# EasyEDA Pro project 接收机铝基板.epro

# Schematic Schematic1
Board Name: Board1; Create Date: 2025-01-26; Page Name: P1; Project Name: 接收机; Schematic Name: Schematic1; Update Date: 2025-01-26; Company: 嘉立创EDA; Page Size: A3; Version: V1.0
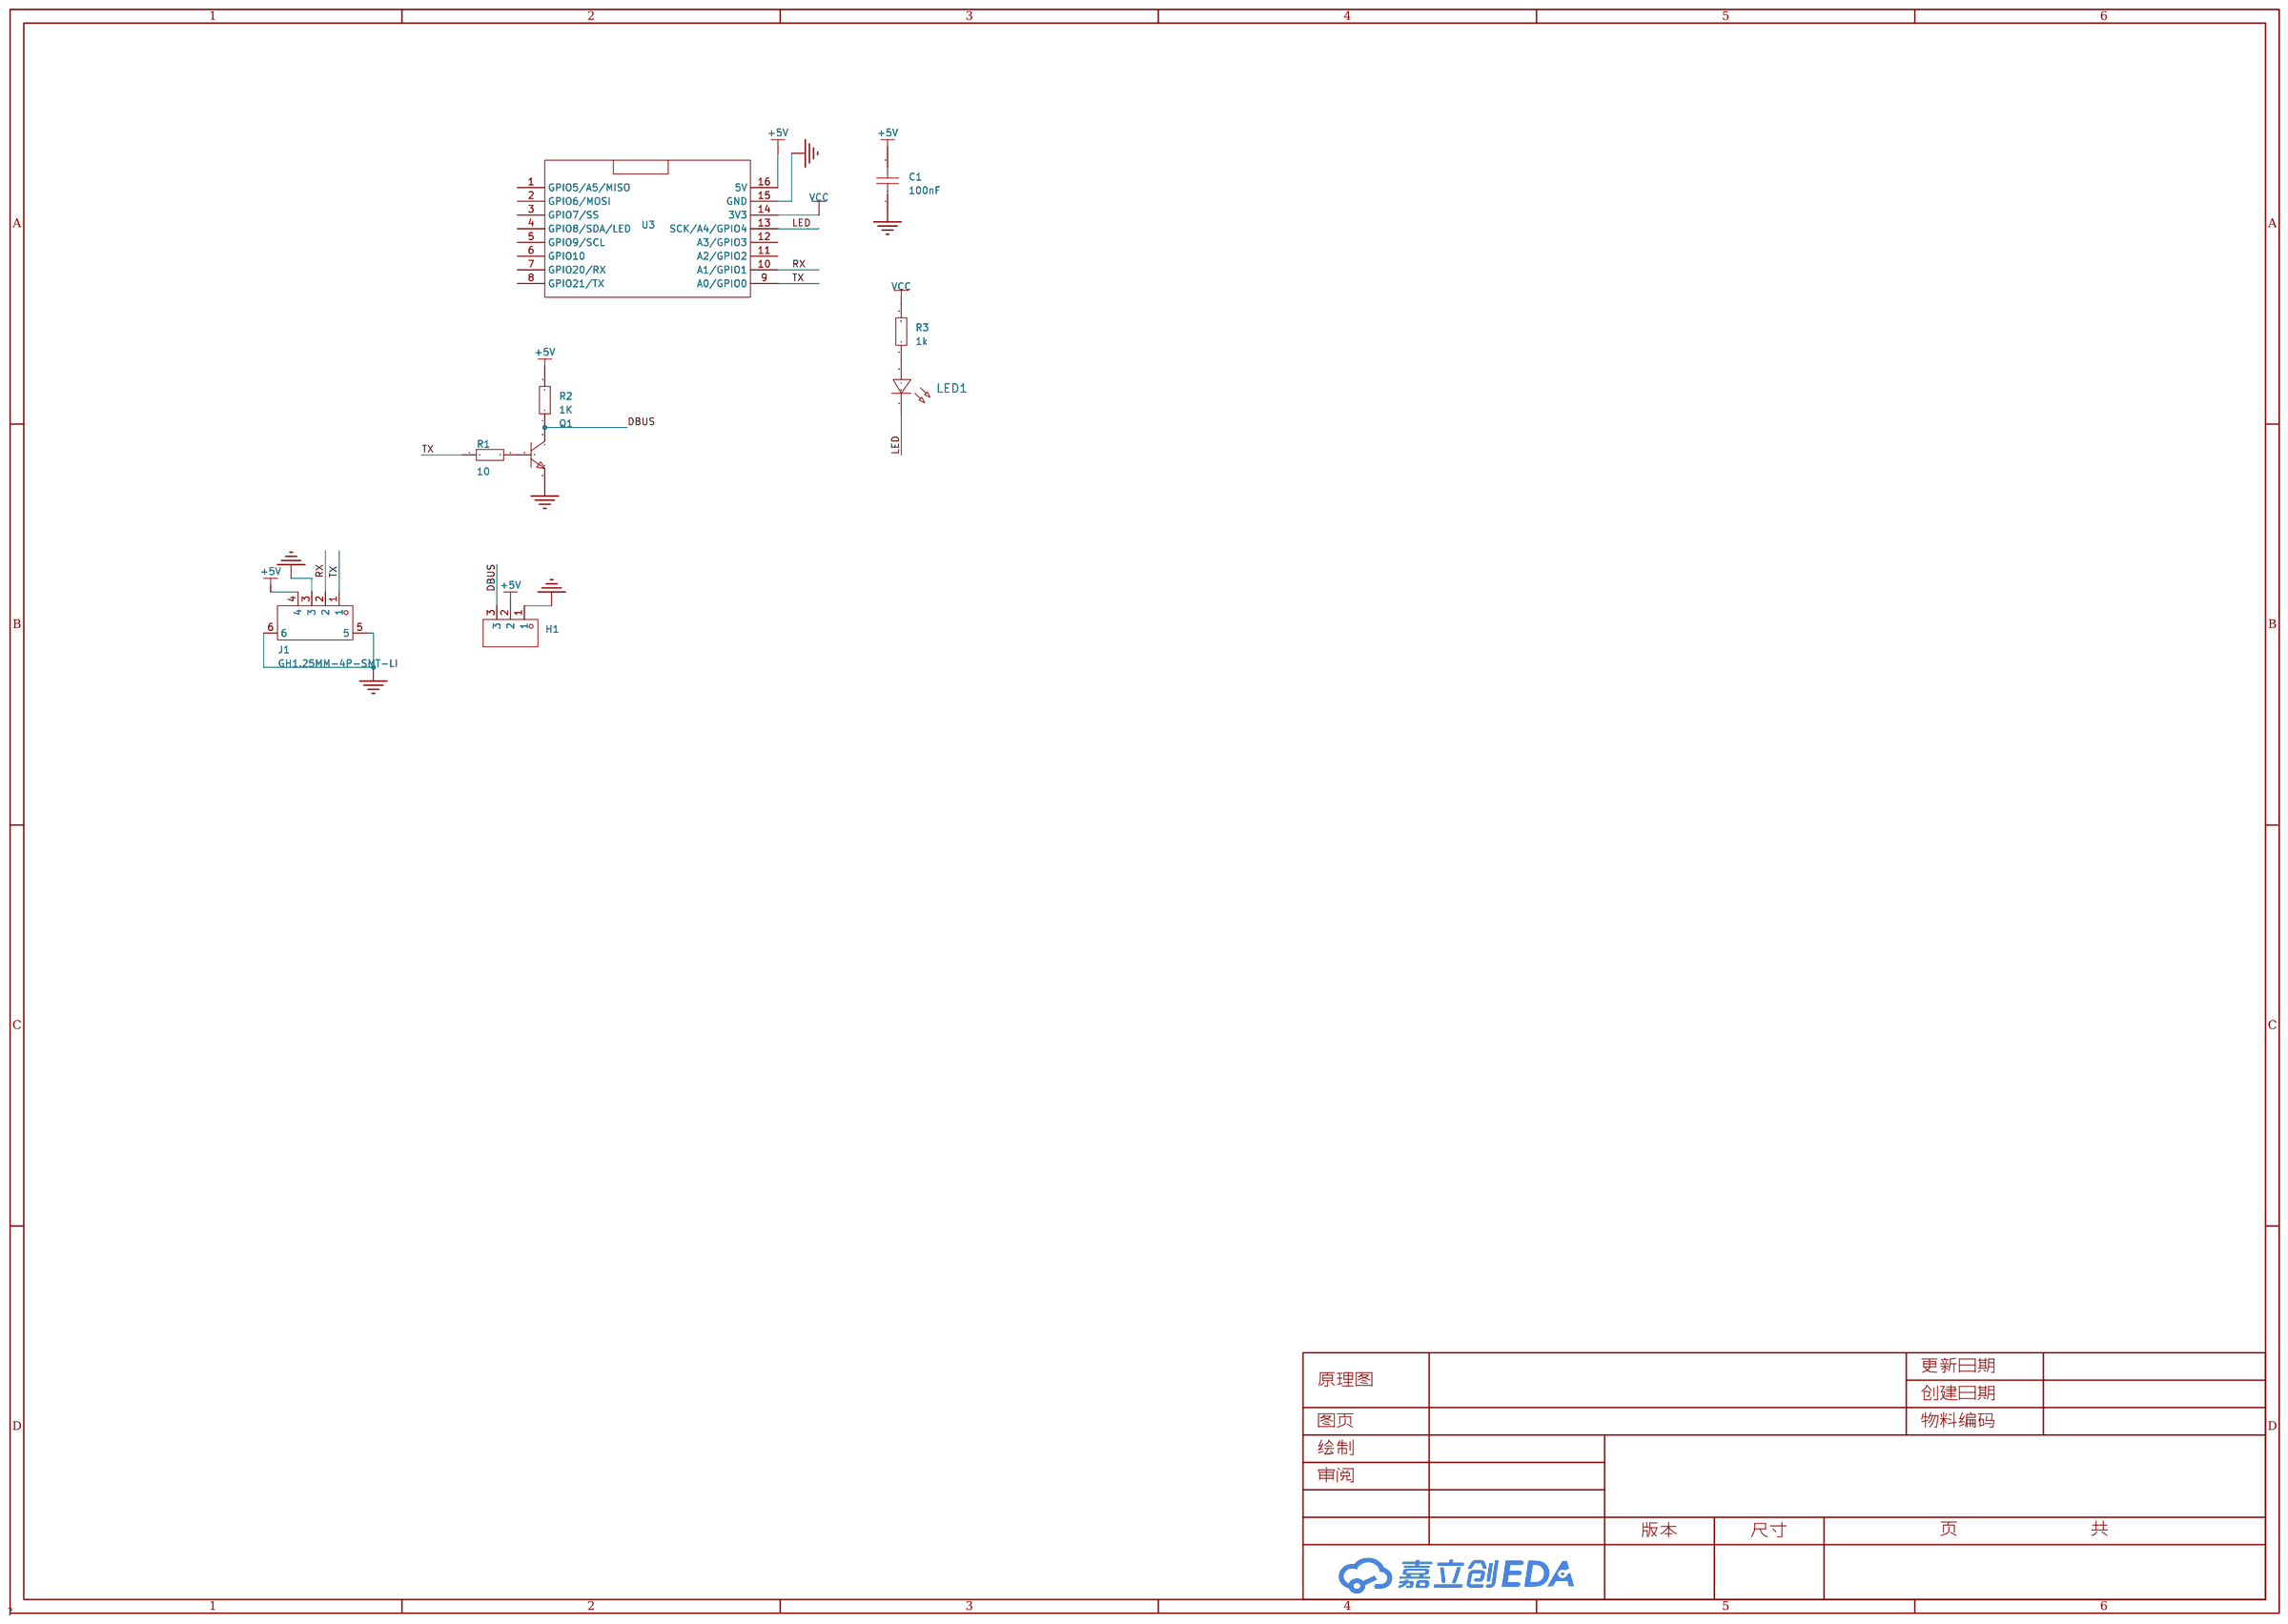
[diagram p0: schematic sheet]

## Parts
C1  100nF  [C0603]
H1  -  [HDR-TH_3P-P2.54-V-M]
J1  GH1.25MM-4P-SMT-LI  [CONN-SMD_4P-P1.25_GH1.25-4PLI]
LED1  -  [LED_0603]
Q1  -  [S8050_SOT-23]
R1  10  [R0402]
R2  1K  [R0402]
R3  1k  [R0402]
U3  -  [SMD_ESP32C3SuperMini]

## Library data of the parts
C1 = CAP_0603: Supplier Footprint: 0603
H1 = HDR-M_2.54_1x3P: Supplier Part: C2937625; Supplier Footprint: 插件
J1 = GH1.25MM-4P-SMT-LI: Supplier Part: C9900017109; Supplier Footprint: GH1.25MM; JLCPCB Part Class: 扩展库; Supplier: LCSC
LED1 = LED_0603-R: Supplier Footprint: 0603
Q1 = S8050_SOT_NPN: Supplier Footprint: SOT-23
R1-R3 = Res_0402: Supplier Footprint: 0402
U3 = ESP32C3SuperMini: ESP32C3SuperMini迷你开发板; 尺寸: 22.52x18mm; Comment: https://www.nologo.tech/product/esp32/esp32c3SuperMini/esp32C3SuperMini.html

## Nets
+5V: C1.2 H1.2 J1.4 R2.2 U3.16(5V)
GND: C1.1 H1.1 J1.3 J1.5 J1.6 Q1.2 U3.15(GND)
VCC: R3.2 U3.14(3V3)
DBUS: H1.3 Q1.3 R2.1
LED: LED1.1(C) U3.13(SCK/A4/GPIO4)
RX: J1.2 U3.10(A1/GPIO1)
TX: J1.1 R1.1 U3.9(A0/GPIO0)
$1N674: Q1.1 R1.2
$1N1321: LED1.2(A) R3.1

Not connected (* = marked no-connect by the designer): U3 1(GPIO5/A5/MISO) 2(GPIO6/MOSI) 3(GPIO7/SS) 4(GPIO8/SDA/LED) 5(GPIO9/SCL) 6(GPIO10) 7(GPIO20/RX) 8(GPIO21/TX) 11(A2/GPIO2) 12(A3/GPIO3)

# Board PCB1
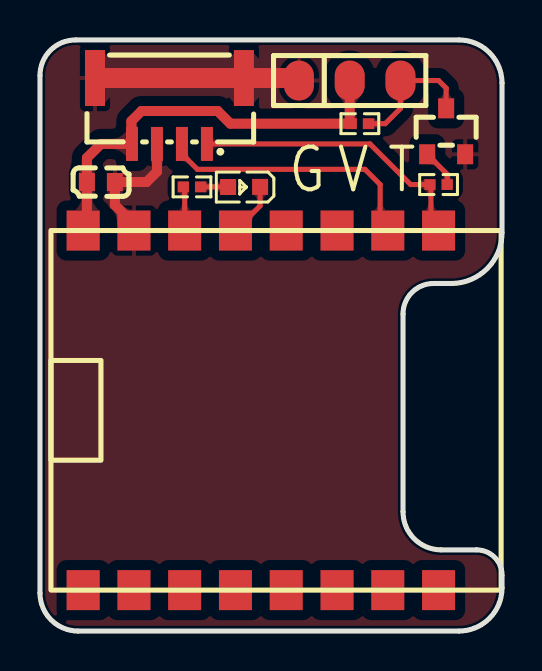
[diagram p1: board, top side]
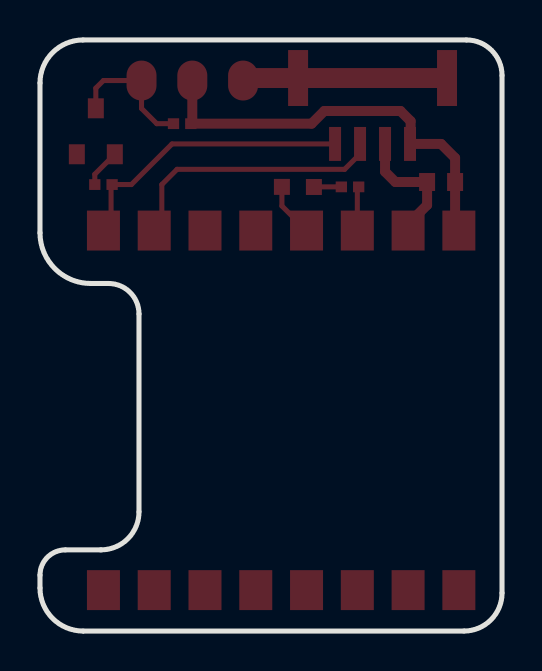
[diagram p2: board, bottom side, seen from below]

Outline 23.11 x 29.59 mm; copper layers: Top Layer, Bottom Layer. Coordinates in mm from the lower left corner of the outline.
Outline path: 0,27.81 0,1.91 arc(0.56,0.56) 1.91,0 20.96,0 arc(22.48,0.63) 23.11,2.16 23.11,2.79 arc(22.74,3.69) 21.84,4.06 20.07,4.06 arc(18.72,4.62) 18.16,5.97 18.16,15.88 arc(18.61,16.95) 19.69,17.4 20.57,17.4 arc(22.37,18.14) 23.11,19.94 23.11,27.43 arc(22.48,28.96) 20.96,29.59 1.78,29.59 arc(0.52,29.07) 0,27.81
Stack: Top Layer 0.035mm / Dielectric1 1.51mm FR4 er 4.5 / Bottom Layer 0.035mm

## Design rules (mm)
template: 自定义配置
spacing copperThickness1oz (default): track to track 0.102, other pairs 0.152 to 0.3
spacing copperThickness2oz: track to track 0.203, other pairs 0.152 to 0.3
track width copperThickness1oz (default): min 0.127, default 0.254, max 2.54
track width copperThickness2oz: min 0.203, default 0.254, max 2.54
differential pair differentialPair (default): width min 0.127, default 0.254, max 2.54; gap min 0.152, default 0.152
via viaSize (default): diameter min 0.5, default 0.61, max 10; hole min 0.3, default 0.305, max 6.3

## Placement (name value [footprint] x y rotation side)
C1  100nF  [C0603]  3.05 22.48 180 top
H1  -  [HDR-TH_3P-P2.54-V-M]  15.49 27.56 0 top
J1  GH1.25MM-4P-SMT-LI  [CONN-SMD_4P-P1.25_GH1.25-4PLI]  6.48 26.03 180 top
LED1  -  [LED_0603]  10.16 22.22 180 top
Q1  -  [S8050_SOT-23]  20.19 25.02 270 top
R1  10  [R0402]  19.94 22.35 0 top
R2  1K  [R0402]  16 25.4 180 top
R3  1k  [R0402]  7.6 22.24 180 top
U3  -  [SMD_ESP32C3SuperMini]  11.05 11.05 90 top

## Footprints (pads in the part's own frame, mm; a bottom-side part is the same pattern mirrored in y, then rotated)
C0603
  rect 0.8x0.9 smd: 1(-0.7,0) 2(0.7,0)
CONN-SMD_4P-P1.25_GH1.25-4PLI
  rect 0.6x1.7 smd: 1(-1.875,1.65) 2(-0.625,1.65) 3(0.625,1.65) 4(1.875,1.65)
  rect 1x2.8 smd: 5(-3.725,-1.65) 6(3.725,-1.65)
HDR-TH_3P-P2.54-V-M
  oval 1.5x2 smd: 1(-2.54,0) 2(0,0) 3(2.54,0)
LED_0603
  rect 0.8x0.8 smd: 1(-0.851,-0.01) 2(0.75,-0.005)
R0402
  rect 0.566x0.54 smd: 1(-0.433,0) 2(0.433,0)
S8050_SOT-23
  rect 1x0.8 smd: 1(1.15,-0.823) 2(1.15,1.077) 3(-1.15,0.127)
SMD_ESP32C3SuperMini
  rect 2x1.651 smd: 1(-9,8.89) 2(-9,6.35) 3(-9,3.81) 4(-9,1.27) 5(-9,-1.27) 6(-9,-3.81) 7(-9,-6.35) 8(-9,-8.89) 9(9,-8.89) 10(9,-6.35) 11(9,-3.81) 12(9,-1.27) 13(9,1.27) 14(9,3.81) 15(9,6.35) 16(9,8.89)

## Nets
As in the schematic.

Pads without a net: U3 1 2 3 4 5 6 7 8 11 12

## Routing (per net, layer and track width the routed paths; a pad name or vN(x,y) marks a point on that pad's centre or on a via; arc(x,y) is an arc through that point)
+5V: length 21.2
  Top Layer w0.5: H1.2 15.49,25.47 15.57,25.4 9.53,25.4 8.89,26.03 5.08,26.03 4.57,25.53 4.57,24.41 J1.4 3.05,24.39 2.35,23.68 C1.2 2.35,20.62 1.78,20.05
GND: length 16.6
  Top Layer w0.5: 4.32,20.05 4.32,20.76 3.75,21.33 C1.1 5.33,22.48 5.85,23 J1.3
  Top Layer w1: J1.6 J1.5 12.83,27.69 H1.1
VCC: length 2.2
  Top Layer w0.254: R3.2 7.24,22.17 U3.14
DBUS: length 6.8
  Top Layer w0.254: 20.32,26.17 20.32,27.18 19.94,27.56 H1.3 18.03,26.16 17.27,25.4 R2.1
LED: length 2.7
  Top Layer w0.254: U3.13 11.01,21.28 LED1.1
RX: length 13.4
  Top Layer w0.254: 17.02,20.05 17.02,22.35 16.26,23.11 7.87,23.11 7.1,23.89 J1.2
TX: length 14.3
  Top Layer w0.254: 19.56,20.05 19.56,22.3 R1.1 18.54,22.35 16.51,24.39 J1.1
$1N674: length 1.9
  Top Layer w0.254: R1.2 20.37,22.87 Q1.1
$1N1321: length 1.4
  Top Layer w0.254: LED1.2 9.41,22.24 R3.1

## Copper pours and planes (outline as drawn; the poured copper is in the pictures)
GND on Top Layer: -3.43,33.15 25.53,33.15 25.53,-3.56 -3.43,-3.56

Small or netless copper shapes (teardrops, artwork), in the pictures only: 33 on Top Layer

## Text on the board
Top Silkscreen Layer: G | V | T
